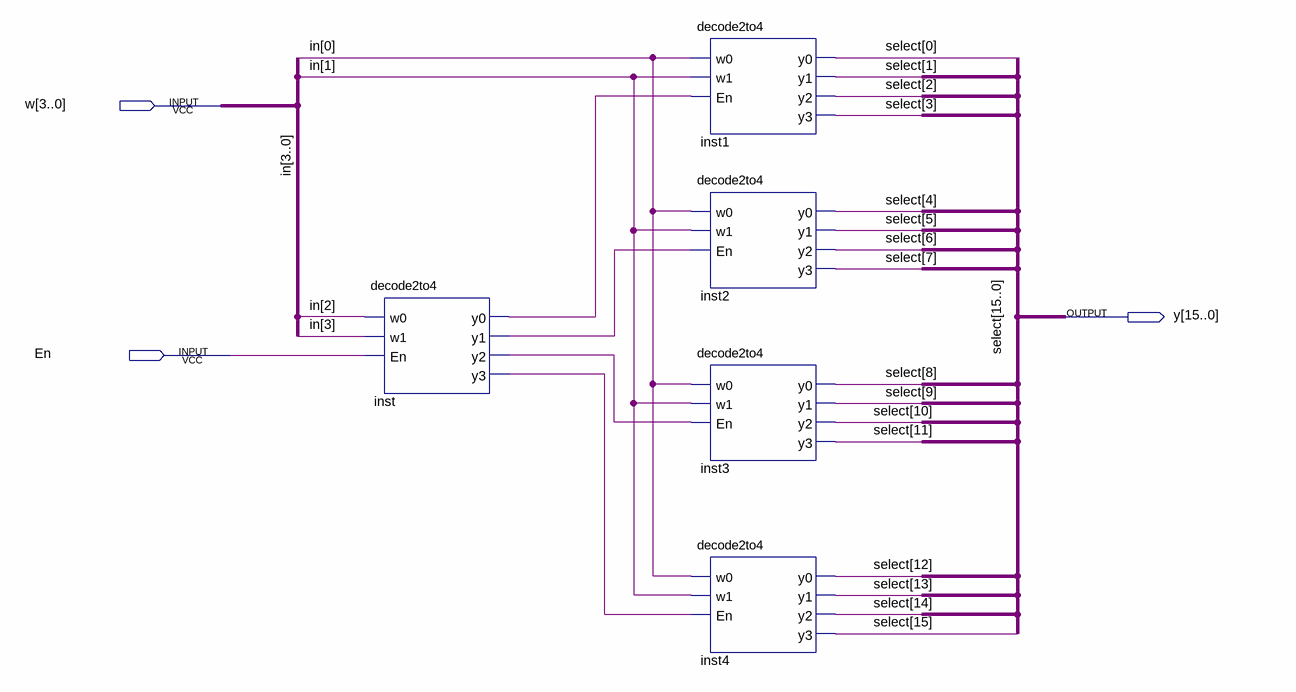
[diagram p0: schematic sheet]
// Quartus schematic 4_16decode.bdf as structural Verilog: 5 symbols, 3 pins
module \4_16decode  (
  input  [3:0] w,
  input  En,
  output [15:0] y
);

  wire inst_y0, inst_y1, inst_y2, inst_y3;

  decode2to4 inst (.w0(w[2]), .w1(w[3]), .En(En), .y0(inst_y0), .y1(inst_y1), .y2(inst_y2), .y3(inst_y3));
  decode2to4 inst1 (.w0(w[0]), .w1(w[1]), .En(inst_y0), .y0(y[0]), .y1(y[1]), .y2(y[2]), .y3(y[3]));
  decode2to4 inst2 (.w0(w[0]), .w1(w[1]), .En(inst_y1), .y0(y[4]), .y1(y[5]), .y2(y[6]), .y3(y[7]));
  decode2to4 inst3 (.w0(w[0]), .w1(w[1]), .En(inst_y2), .y0(y[8]), .y1(y[9]), .y2(y[10]), .y3(y[11]));
  decode2to4 inst4 (.w0(w[0]), .w1(w[1]), .En(inst_y3), .y0(y[12]), .y1(y[13]), .y2(y[14]), .y3(y[15]));

  // Other names for the same wires on the sheet: in[3:0] = w; select[15:0] = y
endmodule
